# Altium schematic sheet RheoBoard_V1.SchDoc
size A0; SheetNumber: 1; SheetTotal: 3
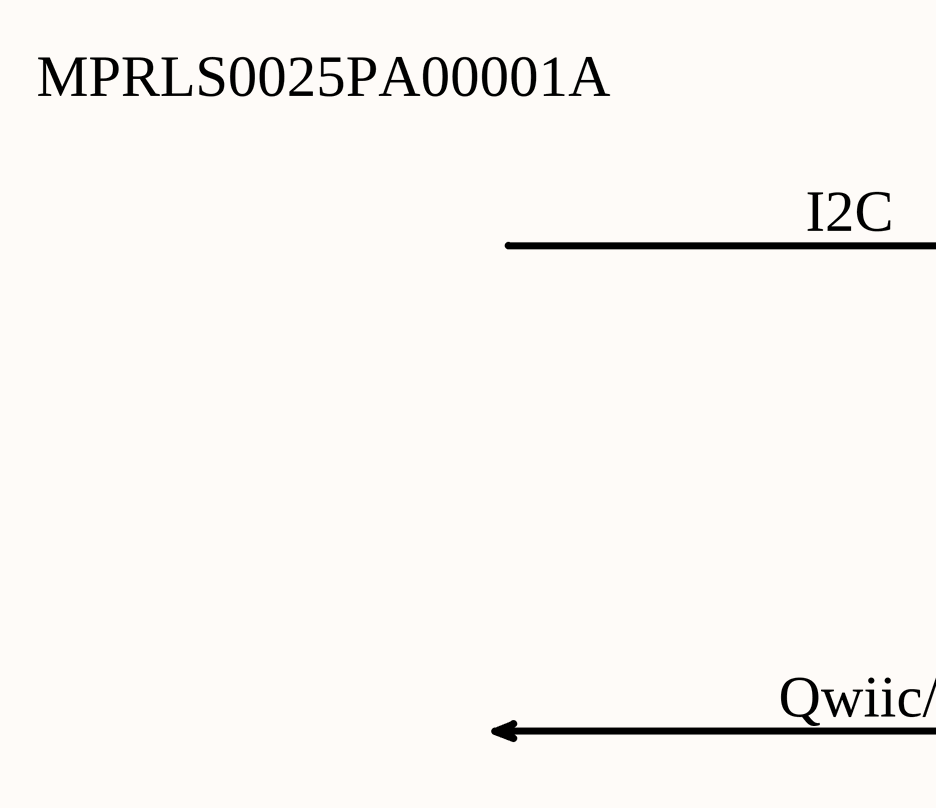
[diagram p0: RheoBoard_V1.SchDoc, top left]
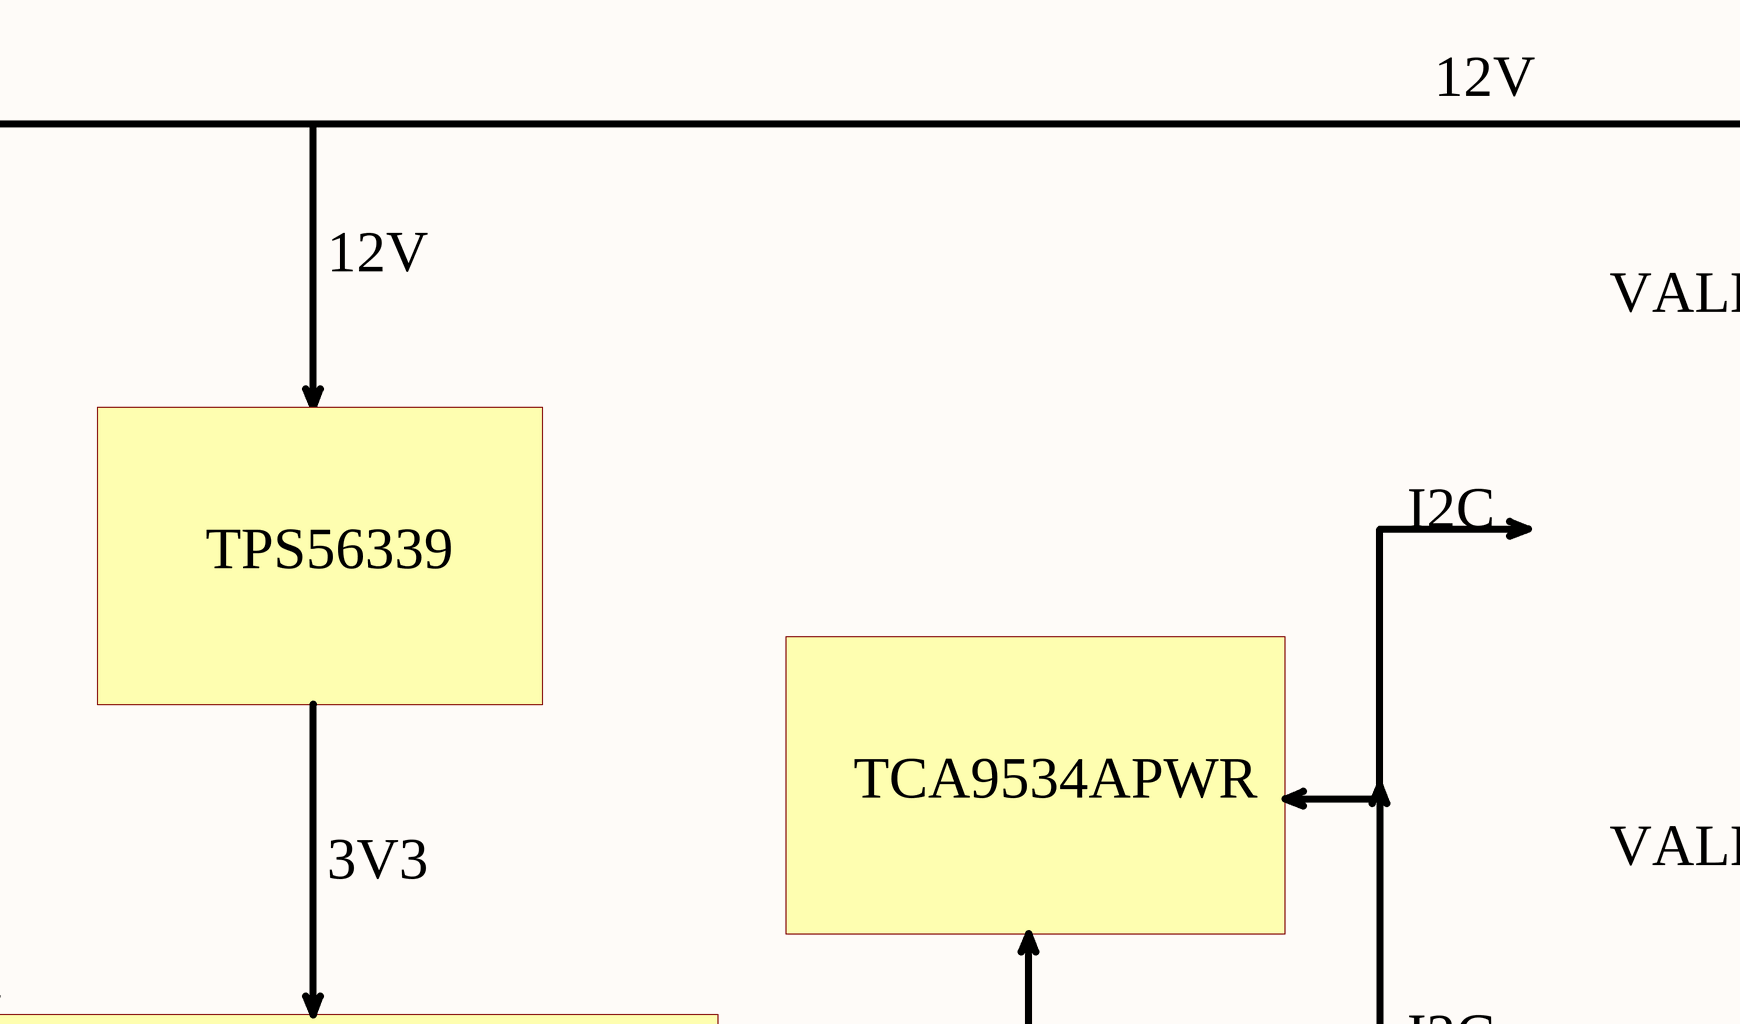
[diagram p1: RheoBoard_V1.SchDoc, top middle]
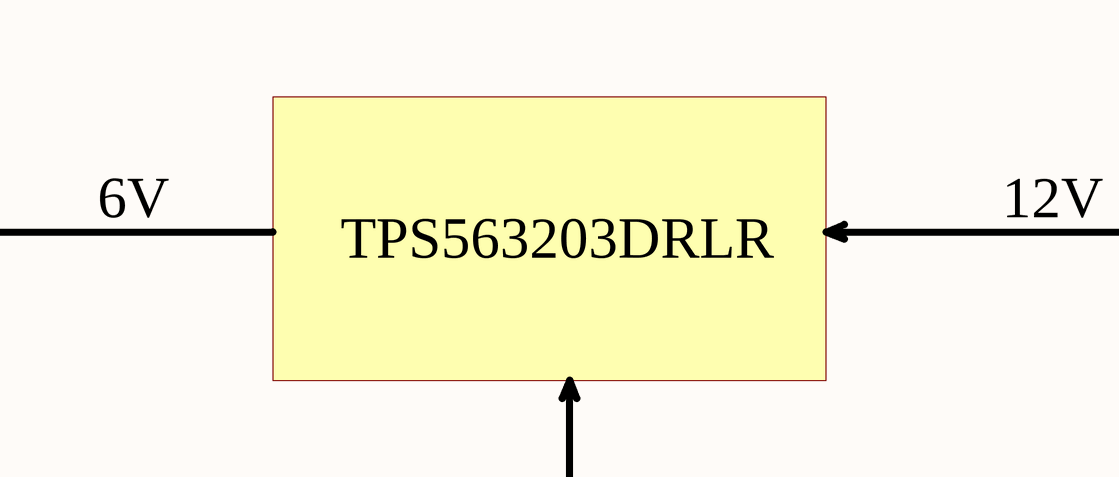
[diagram p2: RheoBoard_V1.SchDoc, top right]
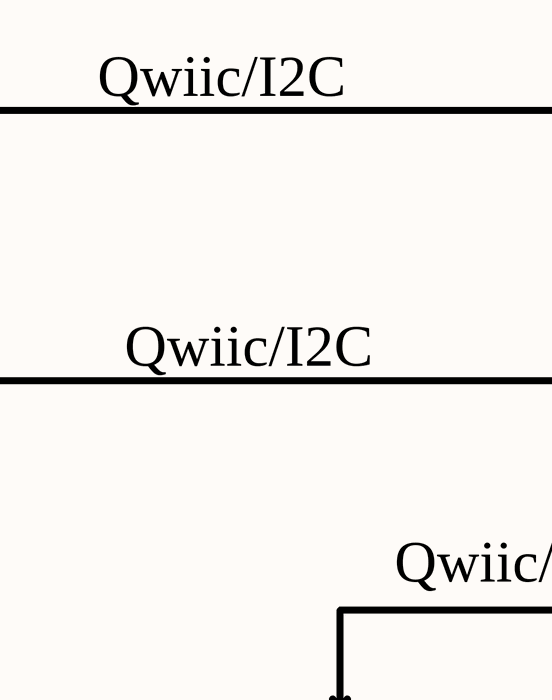
[diagram p3: RheoBoard_V1.SchDoc, bottom left]
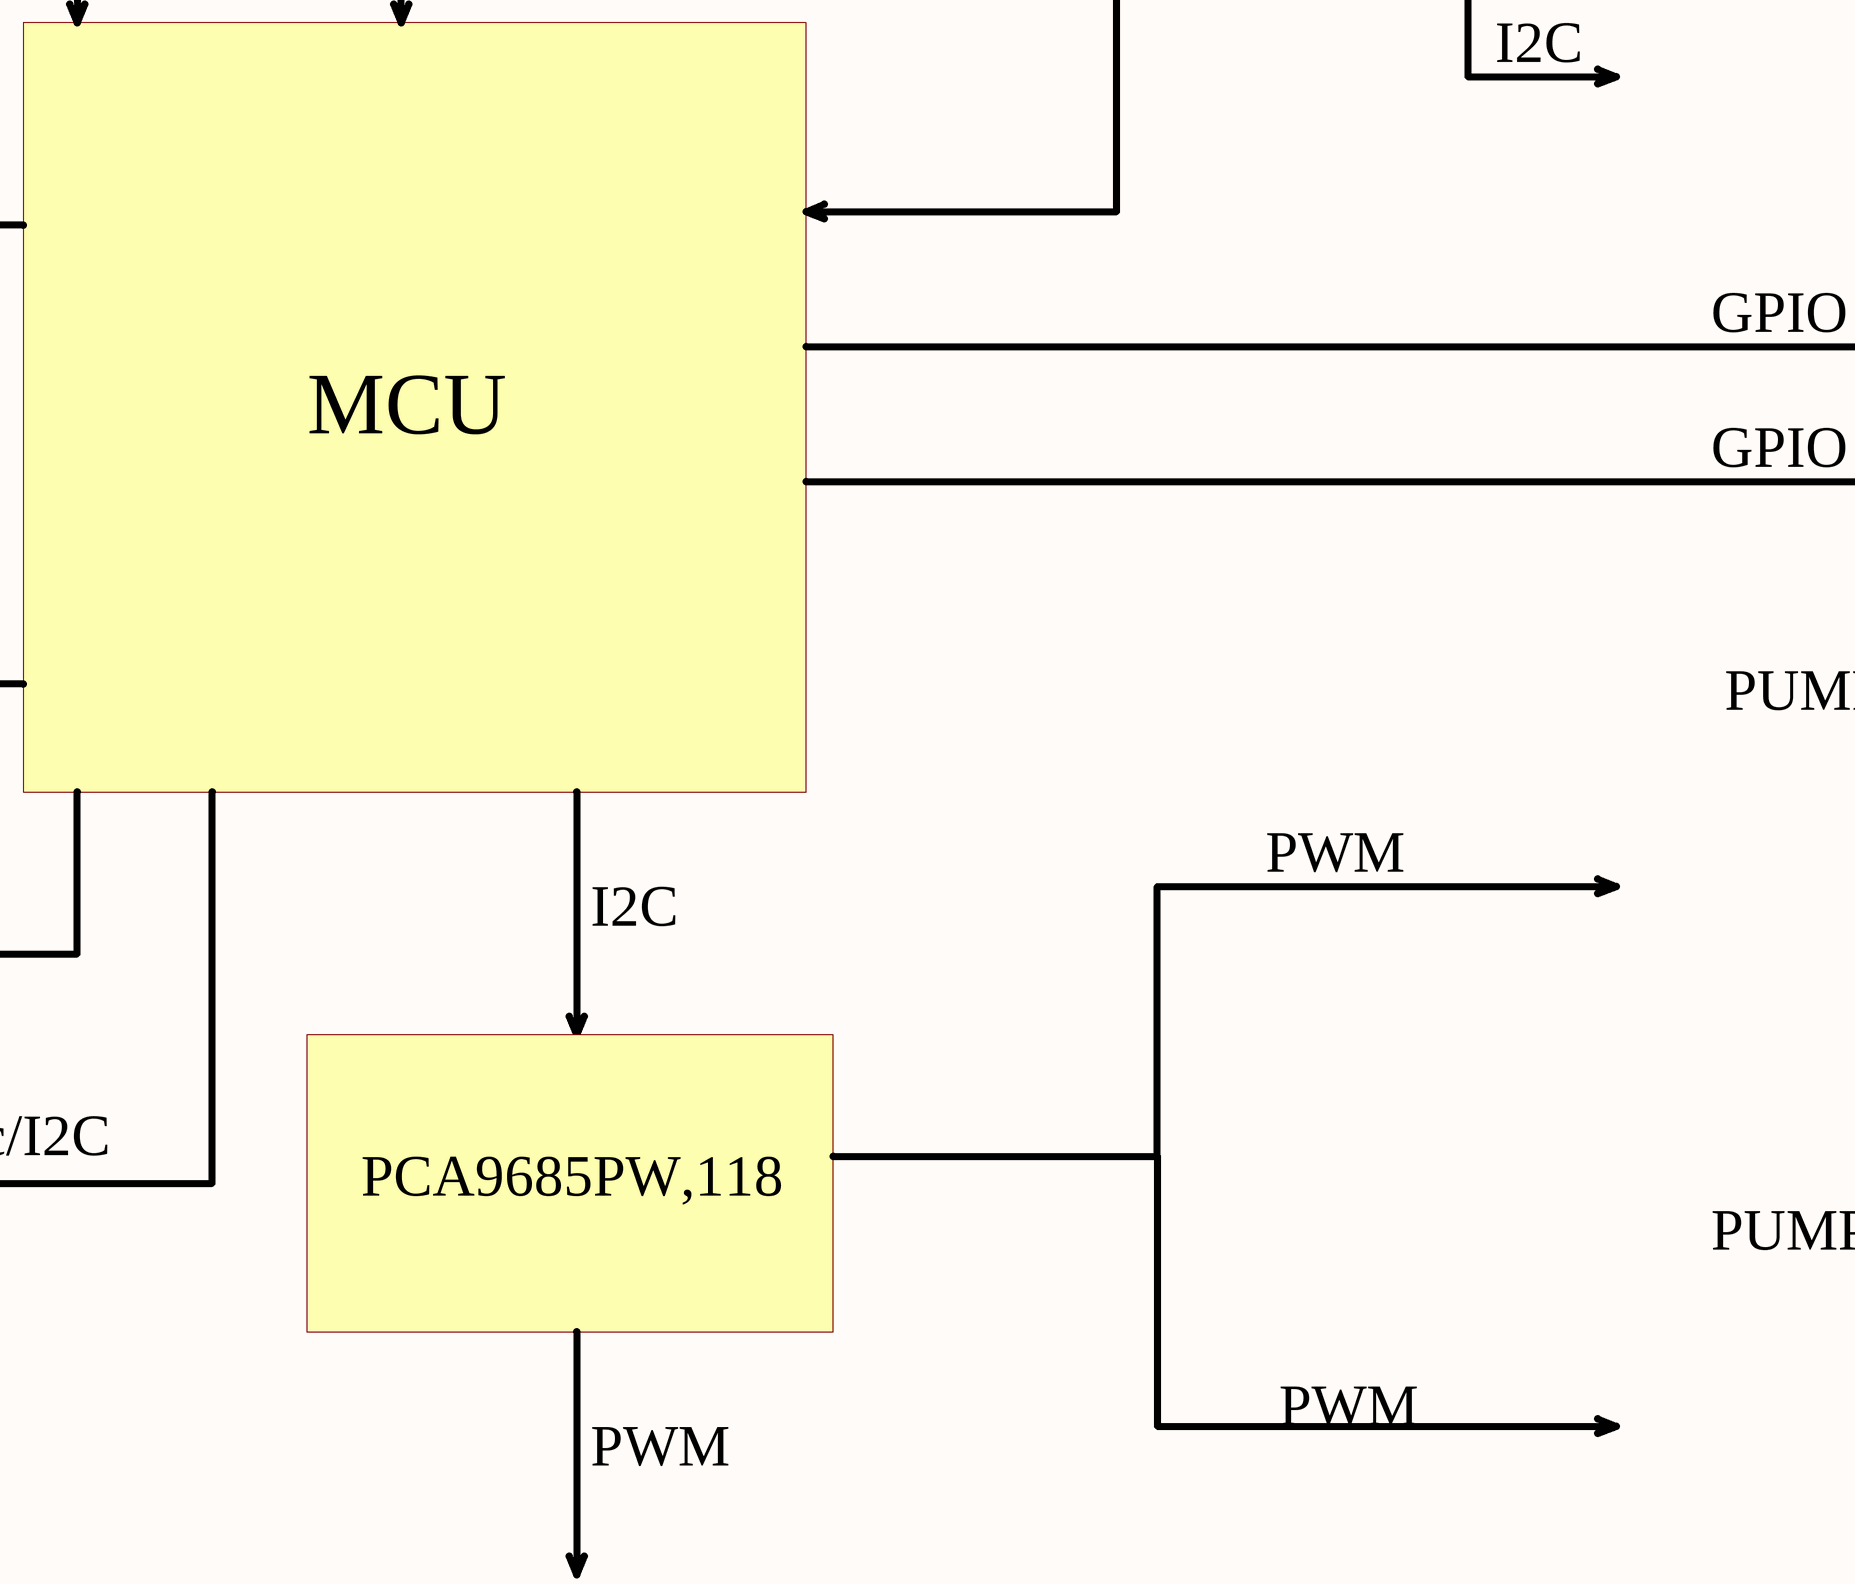
[diagram p4: RheoBoard_V1.SchDoc, bottom middle]
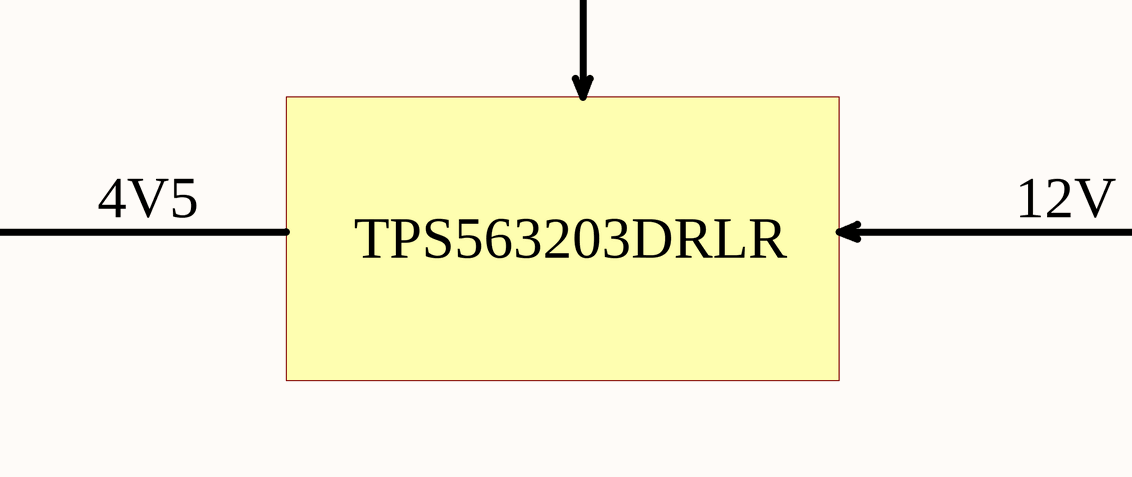
[diagram p5: RheoBoard_V1.SchDoc, bottom right]

## Notes on the sheet
- 12V
- VALE1
- I2C
- MPRLS0025PA00001A
- TPS56339
- TCA9534APWR
- 6V
- 3V3
- VALE2
- TPS563203DRLR
- Qwiic/I2C
- GPIO
- MCU
- PUMP1
- PWM
- 4V5
- PCA9685PW,118
- PUMP2